# Altium project ESC-FPV.PrjPcb
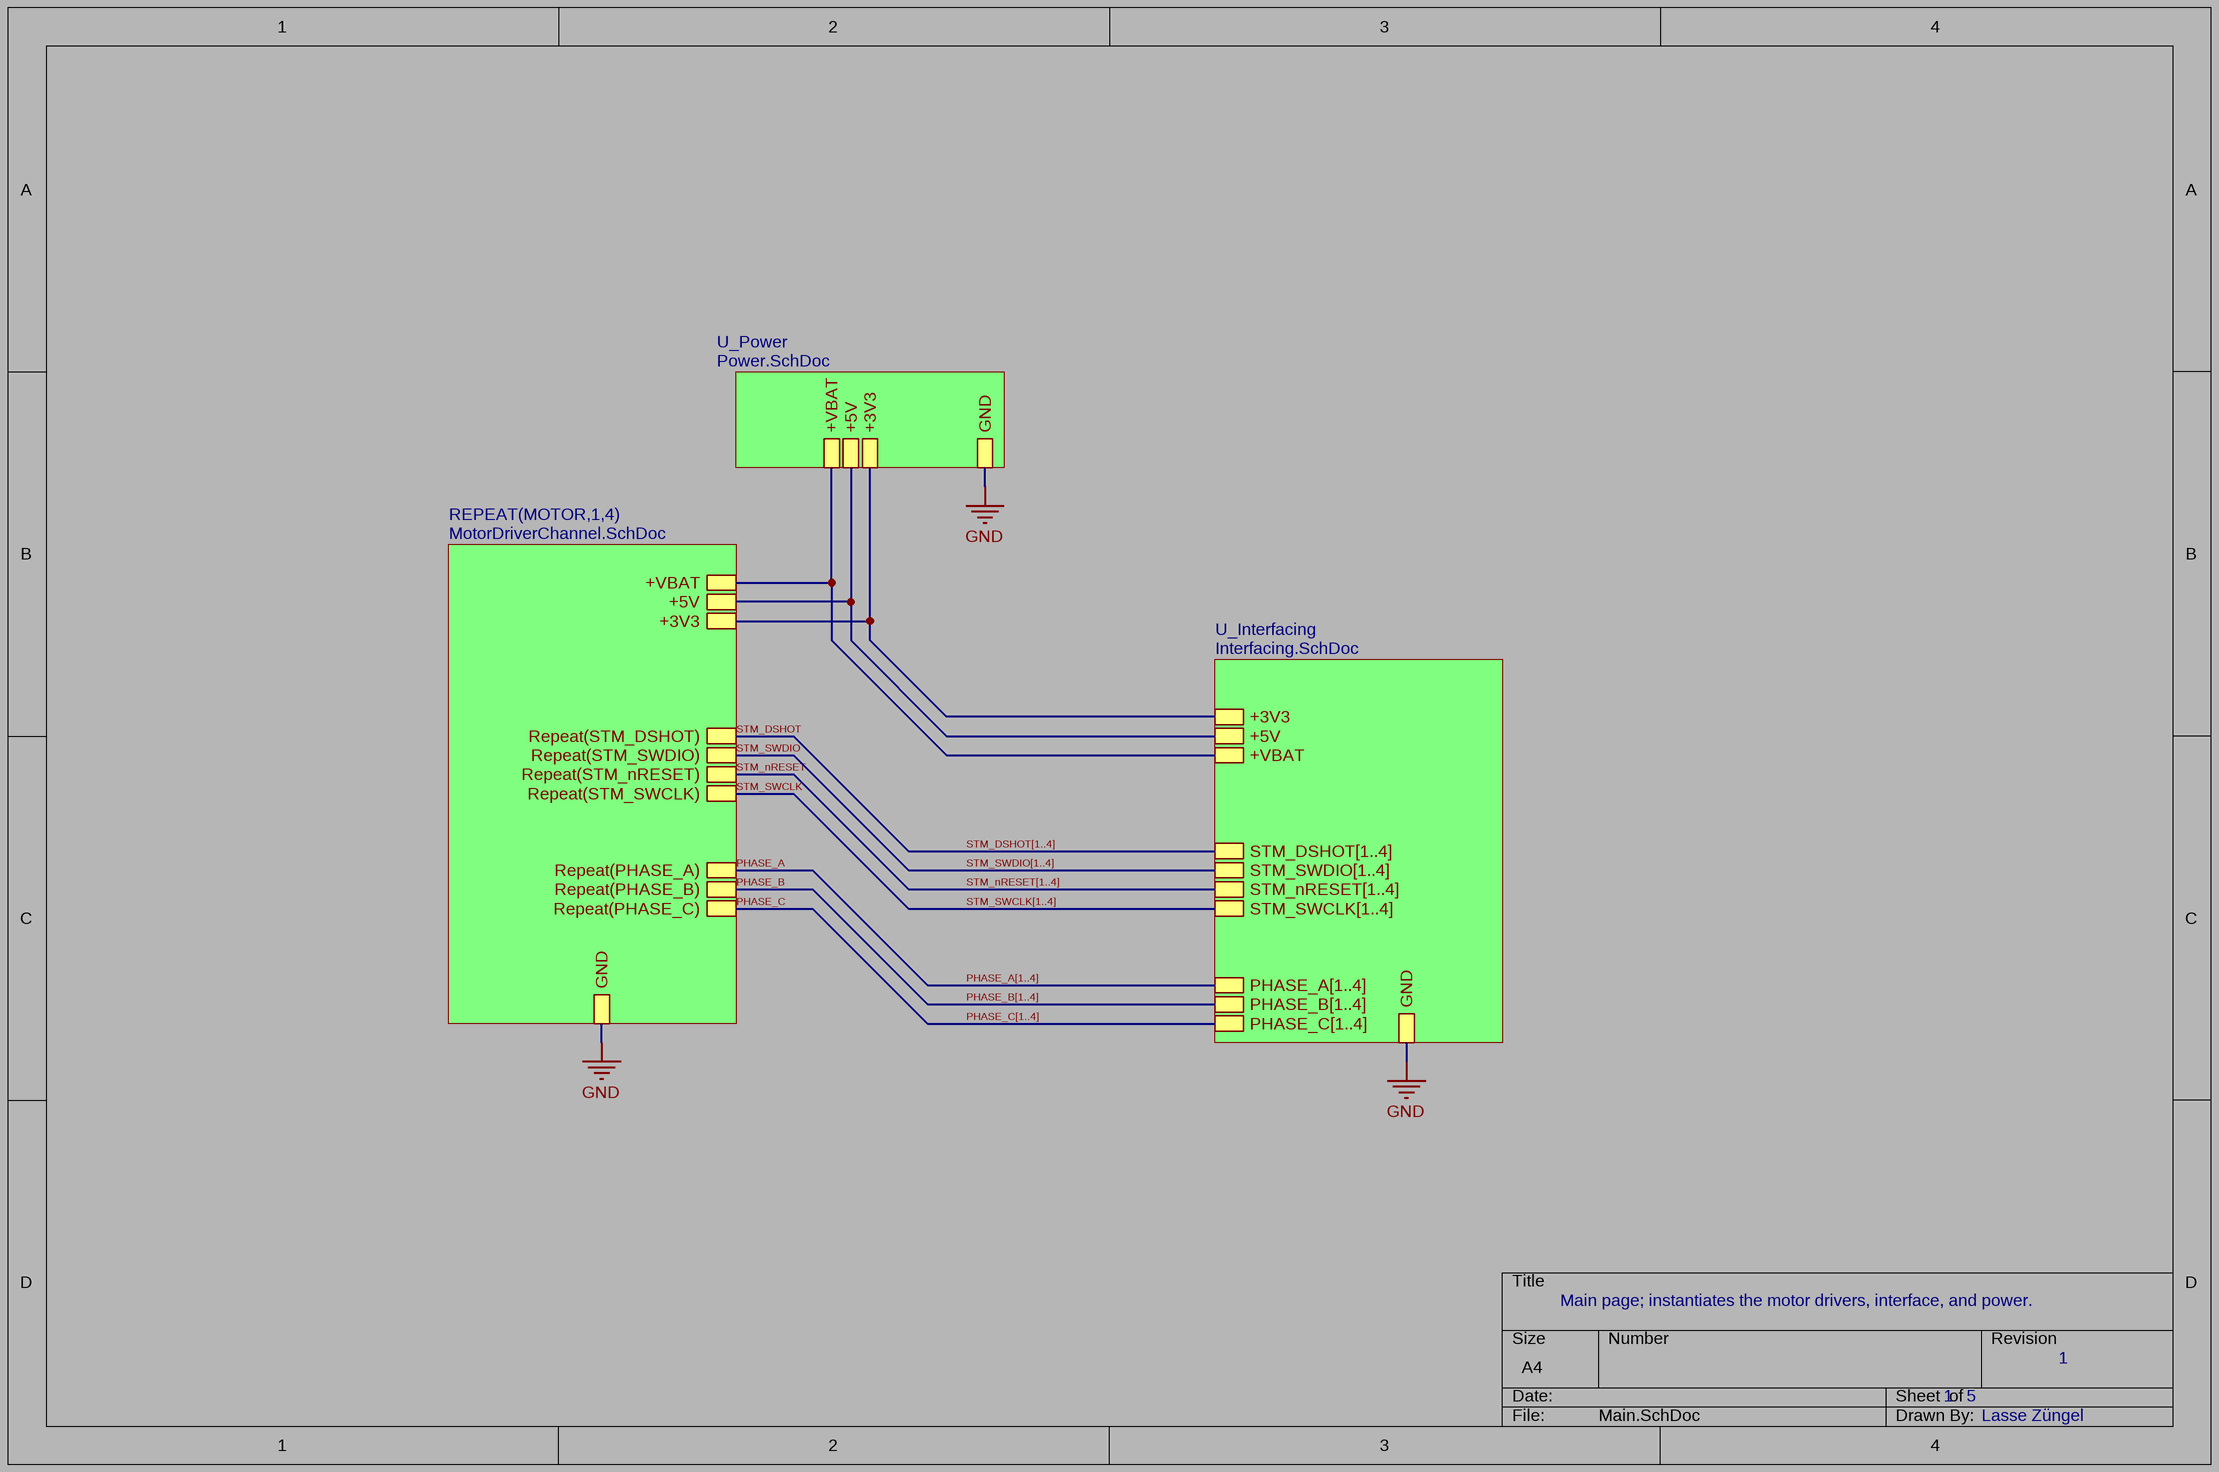
[diagram p0: Main.SchDoc]
5 sheets, 226 parts. Net scope: strictly hierarchical (ports join the sheet entries above them; power ports are local).
Board file: PCB.PcbDoc
Sheets:
  Main.SchDoc
    MOTOR1 = MotorDriverChannel.SchDoc
    MOTOR2 = MotorDriverChannel.SchDoc
    MOTOR3 = MotorDriverChannel.SchDoc
    MOTOR4 = MotorDriverChannel.SchDoc
    U_Power = Power.SchDoc
    U_Interfacing = Interfacing.SchDoc
      MotorConnection1 = MotorConnection.SchDoc
      MotorConnection2 = MotorConnection.SchDoc
      MotorConnection3 = MotorConnection.SchDoc
      MotorConnection4 = MotorConnection.SchDoc

## Sheet Main.SchDoc
size A4; SheetNumber: 1; SheetTotal: 5

### Sub-sheets
REPEAT(MOTOR,1,4) = MotorDriverChannel.SchDoc: +VBAT, +5V, +3V3, GND, Repeat(PHASE_A), Repeat(PHASE_B), Repeat(PHASE_C), Repeat(STM_SWDIO), Repeat(STM_nRESET), Repeat(STM_SWCLK), Repeat(STM_DSHOT)
U_Interfacing = Interfacing.SchDoc: +VBAT, STM_DSHOT[1..4], STM_SWDIO[1..4], STM_SWCLK[1..4], STM_nRESET[1..4], +3V3, +5V, GND, PHASE_A[1..4], PHASE_B[1..4], PHASE_C[1..4]
U_Power = Power.SchDoc: +VBAT, +5V, +3V3, GND

### Nets
+3V3: sheet REPEAT(MOTOR,1,4)/+3V3, sheet U_Power/+3V3, sheet U_Interfacing/+3V3
+5V: sheet REPEAT(MOTOR,1,4)/+5V, sheet U_Power/+5V, sheet U_Interfacing/+5V
+VBAT: sheet REPEAT(MOTOR,1,4)/+VBAT, sheet U_Power/+VBAT, sheet U_Interfacing/+VBAT
GND: sheet REPEAT(MOTOR,1,4)/GND, sheet U_Power/GND, sheet U_Interfacing/GND
PHASE_A: sheet REPEAT(MOTOR,1,4)/Repeat(PHASE_A)
PHASE_B: sheet REPEAT(MOTOR,1,4)/Repeat(PHASE_B)
PHASE_C: sheet REPEAT(MOTOR,1,4)/Repeat(PHASE_C)
STM_DSHOT: sheet REPEAT(MOTOR,1,4)/Repeat(STM_DSHOT)
STM_nRESET: sheet REPEAT(MOTOR,1,4)/Repeat(STM_nRESET)
STM_SWCLK: sheet REPEAT(MOTOR,1,4)/Repeat(STM_SWCLK)
STM_SWDIO: sheet REPEAT(MOTOR,1,4)/Repeat(STM_SWDIO)

### Buses and harness runs
bus PHASE_A[1..4] = sheet U_Interfacing/PHASE_A[1..4]
bus PHASE_B[1..4] = sheet U_Interfacing/PHASE_B[1..4]
bus PHASE_C[1..4] = sheet U_Interfacing/PHASE_C[1..4]
bus STM_DSHOT[1..4] = sheet U_Interfacing/STM_DSHOT[1..4]
bus STM_nRESET[1..4] = sheet U_Interfacing/STM_nRESET[1..4]
bus STM_SWCLK[1..4] = sheet U_Interfacing/STM_SWCLK[1..4]
bus STM_SWDIO[1..4] = sheet U_Interfacing/STM_SWDIO[1..4]

### Notes on the sheet
- Main page; instantiates the motor drivers, interface, and power.
- 1   5
- 1
- Lasse Züngel

## Sheet MotorDriverChannel.SchDoc
size A4; SheetNumber: 2; SheetTotal: 5
Used 4 times, as channels MOTOR1, MOTOR2, MOTOR3, MOTOR4. Parts and nets are listed once, with the designators drawn on the sheet.
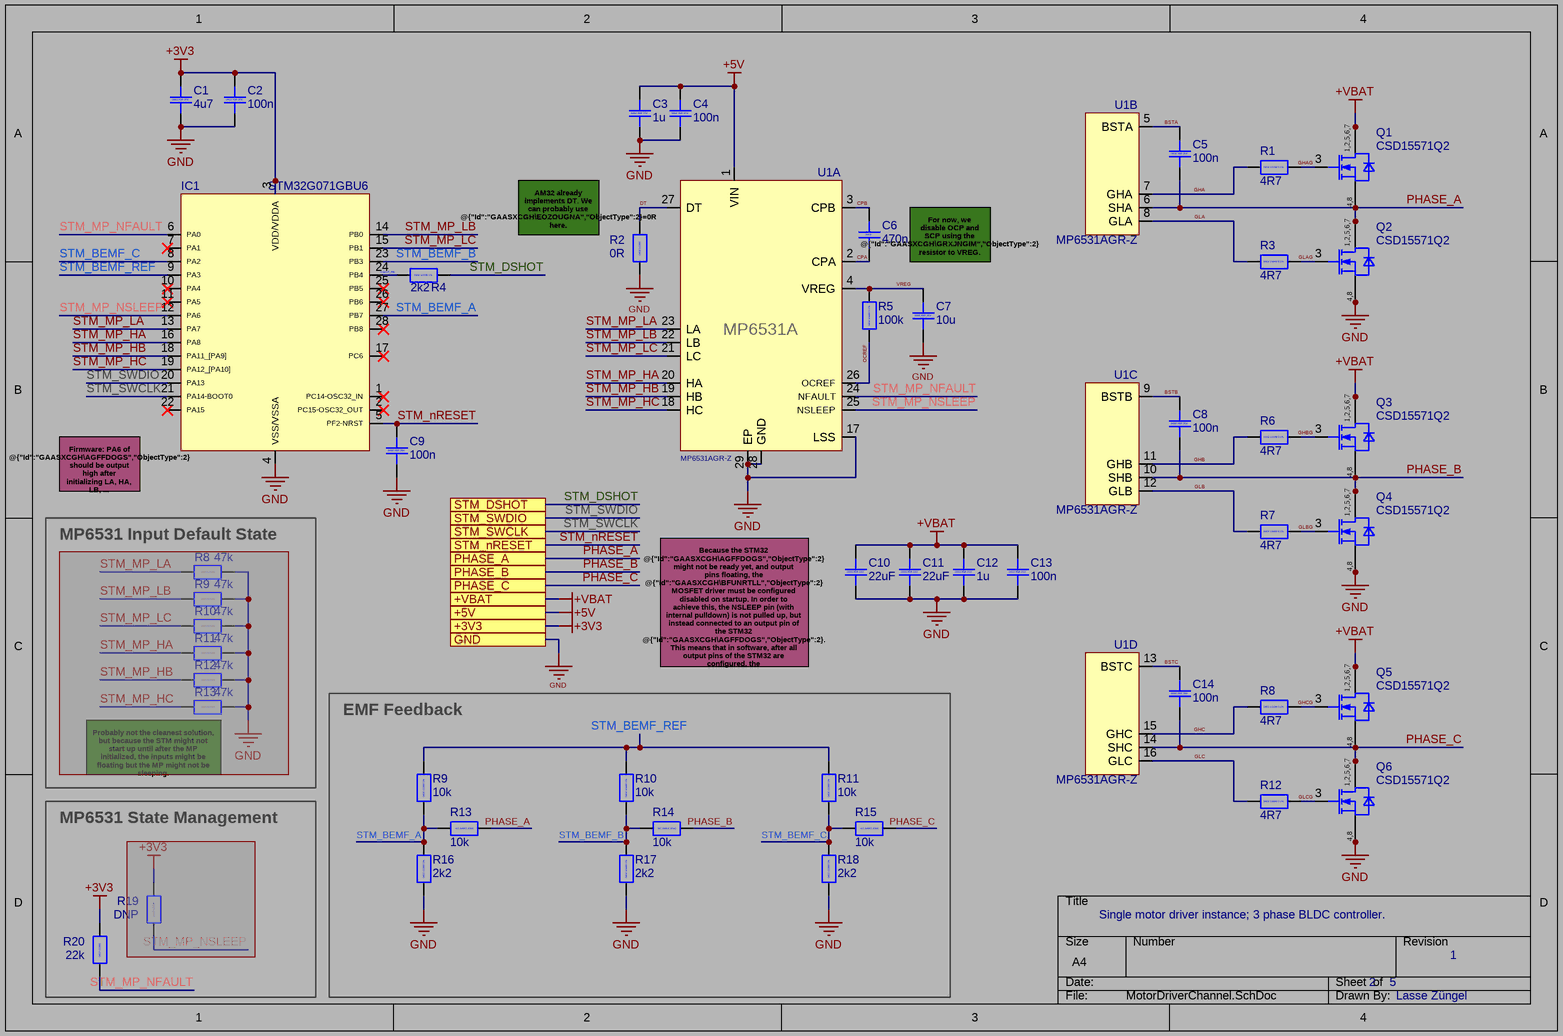
[diagram p1: MotorDriverChannel.SchDoc]

### Parts
(Parts that share a designator on the sheet are numbered #1, #2 ... from top to bottom, then left to right.)
C1  4u7  [CAP_0603_L]
C2  100n  [CAP_0402]
C3  1u  [CAP_0402]
C4  100n  [CAP_0402]
C5  100n  [CAP_0402]
C6  470n  [CAP_0402]
C7  10u  [CAP_0805s]
C8  100n  [CAP_0402]
C9  100n  [CAP_0402]
C10  22uF  [CAP_0805s]
C11  22uF  [CAP_0805s]
C12  1u  [CAP_0603_L]
C13  100n  [CAP_0402]
C14  100n  [CAP_0402]
IC1  STM32G071GBU6  [UFQFN28-STM32]
Q1  CSD15571Q2  [CSD15571Q2]
Q2  CSD15571Q2  [CSD15571Q2]
Q3  CSD15571Q2  [CSD15571Q2]
Q4  CSD15571Q2  [CSD15571Q2]
Q5  CSD15571Q2  [CSD15571Q2]
Q6  CSD15571Q2  [CSD15571Q2]
R1  4R7  [RES_0402]
R2  0R  [RES_0402]
R3  4R7  [RES_0402]
R4  2k2  [RES_0402]
R5  100k  [RES_0402]
R6  4R7  [RES_0402]
R7  4R7  [RES_0402]
R8#1  47k  [RES_0402]  (masked out: inside a compile mask, not in the netlist)
R8#2  4R7  [RES_0402]
R9#1  47k  [RES_0402]  (masked out: inside a compile mask, not in the netlist)
R9#2  10k  [RES_0402]
R10#1  47k  [RES_0402]  (masked out: inside a compile mask, not in the netlist)
R10#2  10k  [RES_0402]
R11#1  47k  [RES_0402]  (masked out: inside a compile mask, not in the netlist)
R11#2  10k  [RES_0402]
R12#1  47k  [RES_0402]  (masked out: inside a compile mask, not in the netlist)
R12#2  4R7  [RES_0402]
R13#1  47k  [RES_0402]  (masked out: inside a compile mask, not in the netlist)
R13#2  10k  [RES_0402]
R14  10k  [RES_0402]
R15  10k  [RES_0402]
R16  2k2  [RES_0402]
R17  2k2  [RES_0402]
R18  2k2  [RES_0402]
R19  DNP  [RES_0402]  (masked out: inside a compile mask, not in the netlist)
R20  22k  [RES_0402]
U1  MP6531AGR-Z  [MP6531A-QFN40P400X400X100-29N]  (parts A,B,C,D of 4)

### Blocks framed on the sheet
MP6531 Input Default State: R8#1 R9#1 R10#1 R11#1 R12#1 R13#1
EMF Feedback: R9#2 R10#2 R11#2 R13#2 R14-R18
MP6531 State Management: R19 R20

### Ports
+3V3 (see Main[2B], Interfacing[1A], Power[1B]), +5V (see Main[2B], Interfacing[1A], Power[1B]), +VBAT (see Main[2B], Interfacing[2B], Power[1B]), GND (see Main[2C], Interfacing[1A], Power[1B]), PHASE_A (see Main[2C], MotorConnection[1A]), PHASE_B (see Main[2C], MotorConnection[1A]), PHASE_C (see Main[2C], MotorConnection[1A]), STM_DSHOT (see Main[2C]), STM_nRESET (see Main[2C]), STM_SWCLK (see Main[2C]), STM_SWDIO (see Main[2C])

### Nets
+3V3: C1.2 C2.2 IC1.3(VDD/VDDA) R20.2 ; port +3V3
+5V: C3.2 C4.2 U1.1(VIN) ; port +5V
+VBAT: C10.2 C11.2 C12.2 C13.2 Q1.1(D_1) Q1.2(D_2) Q1.5(D_3) Q1.6(D_4) Q1.7(D_5) Q3.1(D_1) Q3.2(D_2) Q3.5(D_3) Q3.6(D_4) Q3.7(D_5) Q5.1(D_1) Q5.2(D_2) Q5.5(D_3) Q5.6(D_4) Q5.7(D_5) ; port +VBAT
GND: C1.1 C2.1 C3.1 C4.1 C7.1 C9.1 C10.1 C11.1 C12.1 C13.1 IC1.4(VSS/VSSA) Q2.4(S_1) Q2.8(S_2) Q4.4(S_1) Q4.8(S_2) Q6.4(S_1) Q6.8(S_2) R2.1 R16.1 R17.1 R18.1 U1.17(LSS) U1.28(GND) U1.29(EP) ; port GND
BSTA: C5.2 U1.5(BSTA)
BSTB: C8.2 U1.9(BSTB)
BSTC: C14.2 U1.13(BSTC)
CPA: C6.1 U1.2(CPA)
CPB: C6.2 U1.3(CPB)
DSHOT_PIN: IC1.24(PB4) R4.1
DT: R2.2 U1.27(DT)
GHA: R1.1 U1.7(GHA)
GHAG: Q1.3(G) R1.2
GHB: R6.1 U1.11(GHB)
GHBG: Q3.3(G) R6.2
GHC: R8#2.1 U1.15(GHC)
GHCG: Q5.3(G) R8#2.2
GLA: R3.1 U1.8(GLA)
GLAG: Q2.3(G) R3.2
GLB: R7.1 U1.12(GLB)
GLBG: Q4.3(G) R7.2
GLC: R12#2.1 U1.16(GLC)
GLCG: Q6.3(G) R12#2.2
OCREF: R5.1 U1.26(OCREF)
PHASE_A: C5.1 Q1.4(S_1) Q1.8(S_2) Q2.1(D_1) Q2.2(D_2) Q2.5(D_3) Q2.6(D_4) Q2.7(D_5) R13#2.1 U1.6(SHA) ; port PHASE_A
PHASE_B: C8.1 Q3.4(S_1) Q3.8(S_2) Q4.1(D_1) Q4.2(D_2) Q4.5(D_3) Q4.6(D_4) Q4.7(D_5) R14.1 U1.10(SHB) ; port PHASE_B
PHASE_C: C14.1 Q5.4(S_1) Q5.8(S_2) Q6.1(D_1) Q6.2(D_2) Q6.5(D_3) Q6.6(D_4) Q6.7(D_5) R15.1 U1.14(SHC) ; port PHASE_C
STM_BEMF_A: IC1.27(PB7) R9#2.1 R13#2.2 R16.2
STM_BEMF_B: IC1.23(PB3) R10#2.1 R14.2 R17.2
STM_BEMF_C: IC1.8(PA2) R11#2.1 R15.2 R18.2
STM_BEMF_REF: IC1.9(PA3) R9#2.2 R10#2.2 R11#2.2
STM_DSHOT: R4.2 ; port STM_DSHOT
STM_MP_HA: IC1.16(PA8) U1.20(HA)
STM_MP_HB: IC1.18(PA11_[PA9]) U1.19(HB)
STM_MP_HC: IC1.19(PA12_[PA10]) U1.18(HC)
STM_MP_LA: IC1.13(PA7) U1.23(LA)
STM_MP_LB: IC1.14(PB0) U1.22(LB)
STM_MP_LC: IC1.15(PB1) U1.21(LC)
STM_MP_NFAULT: IC1.6(PA0) R20.1 U1.24(NFAULT)
STM_MP_NSLEEP: IC1.12(PA6) U1.25(NSLEEP)
STM_nRESET: C9.2 IC1.5(PF2-NRST) ; port STM_nRESET
STM_SWCLK: IC1.21(PA14-BOOT0) ; port STM_SWCLK
STM_SWDIO: IC1.20(PA13) ; port STM_SWDIO
VREG: C7.2 R5.2 U1.4(VREG)

Not connected (* = marked no-connect by the designer): IC1 1(PC14-OSC32_IN)* 2(PC15-OSC32_OUT)* 7(PA1)* 10(PA4)* 11(PA5)* 17(PC6)* 22(PA15)* 25(PB5)* 26(PB6)* 28(PB8)*

### Channels
MOTOR1: designators C1=C1_MOTOR1 C2=C2_MOTOR1 C3=C3_MOTOR1 C4=C4_MOTOR1 C5=C5_MOTOR1 C6=C6_MOTOR1 C7=C7_MOTOR1 C8=C8_MOTOR1 C9=C9_MOTOR1 C10=C10_MOTOR1 C11=C11_MOTOR1 C12=C12_MOTOR1 C13=C13_MOTOR1 C14=C14_MOTOR1 IC1=IC1_MOTOR1 Q1=Q1_MOTOR1 Q2=Q2_MOTOR1 Q3=Q3_MOTOR1 Q4=Q4_MOTOR1 Q5=Q5_MOTOR1 Q6=Q6_MOTOR1 R1=R1_MOTOR1 R2=R2_MOTOR1 R3=R3_MOTOR1 R4=R4_MOTOR1 R5=R5_MOTOR1 R6=R6_MOTOR1 R7=R7_MOTOR1 R8=R8_MOTOR1#1 R8=R8_MOTOR1#2 R9=R9_MOTOR1#1 R9=R9_MOTOR1#2 R10=R10_MOTOR1#1 R10=R10_MOTOR1#2 R11=R11_MOTOR1#1 R11=R11_MOTOR1#2 R12=R12_MOTOR1#1 R12=R12_MOTOR1#2 R13=R13_MOTOR1#1 R13=R13_MOTOR1#2 R14=R14_MOTOR1 R15=R15_MOTOR1 R16=R16_MOTOR1 R17=R17_MOTOR1 R18=R18_MOTOR1 R19=R19_MOTOR1 R20=R20_MOTOR1 U1=U1_MOTOR1; ports +3V3=+3V3 +5V=+5V +VBAT=+VBAT GND=GND PHASE_A=PHASE_A1 PHASE_B=PHASE_B1 PHASE_C=PHASE_C1 STM_DSHOT=STM_DSHOT1 STM_nRESET=STM_nRESET1 STM_SWCLK=STM_SWCLK1 STM_SWDIO=STM_SWDIO1
MOTOR2: designators C1=C1_MOTOR2 C2=C2_MOTOR2 C3=C3_MOTOR2 C4=C4_MOTOR2 C5=C5_MOTOR2 C6=C6_MOTOR2 C7=C7_MOTOR2 C8=C8_MOTOR2 C9=C9_MOTOR2 C10=C10_MOTOR2 C11=C11_MOTOR2 C12=C12_MOTOR2 C13=C13_MOTOR2 C14=C14_MOTOR2 IC1=IC1_MOTOR2 Q1=Q1_MOTOR2 Q2=Q2_MOTOR2 Q3=Q3_MOTOR2 Q4=Q4_MOTOR2 Q5=Q5_MOTOR2 Q6=Q6_MOTOR2 R1=R1_MOTOR2 R2=R2_MOTOR2 R3=R3_MOTOR2 R4=R4_MOTOR2 R5=R5_MOTOR2 R6=R6_MOTOR2 R7=R7_MOTOR2 R8=R8_MOTOR2#1 R8=R8_MOTOR2#2 R9=R9_MOTOR2#1 R9=R9_MOTOR2#2 R10=R10_MOTOR2#1 R10=R10_MOTOR2#2 R11=R11_MOTOR2#1 R11=R11_MOTOR2#2 R12=R12_MOTOR2#1 R12=R12_MOTOR2#2 R13=R13_MOTOR2#1 R13=R13_MOTOR2#2 R14=R14_MOTOR2 R15=R15_MOTOR2 R16=R16_MOTOR2 R17=R17_MOTOR2 R18=R18_MOTOR2 R19=R19_MOTOR2 R20=R20_MOTOR2 U1=U1_MOTOR2; ports +3V3=+3V3 +5V=+5V +VBAT=+VBAT GND=GND PHASE_A=PHASE_A2 PHASE_B=PHASE_B2 PHASE_C=PHASE_C2 STM_DSHOT=STM_DSHOT2 STM_nRESET=STM_nRESET2 STM_SWCLK=STM_SWCLK2 STM_SWDIO=STM_SWDIO2
MOTOR3: designators C1=C1_MOTOR3 C2=C2_MOTOR3 C3=C3_MOTOR3 C4=C4_MOTOR3 C5=C5_MOTOR3 C6=C6_MOTOR3 C7=C7_MOTOR3 C8=C8_MOTOR3 C9=C9_MOTOR3 C10=C10_MOTOR3 C11=C11_MOTOR3 C12=C12_MOTOR3 C13=C13_MOTOR3 C14=C14_MOTOR3 IC1=IC1_MOTOR3 Q1=Q1_MOTOR3 Q2=Q2_MOTOR3 Q3=Q3_MOTOR3 Q4=Q4_MOTOR3 Q5=Q5_MOTOR3 Q6=Q6_MOTOR3 R1=R1_MOTOR3 R2=R2_MOTOR3 R3=R3_MOTOR3 R4=R4_MOTOR3 R5=R5_MOTOR3 R6=R6_MOTOR3 R7=R7_MOTOR3 R8=R8_MOTOR3#1 R8=R8_MOTOR3#2 R9=R9_MOTOR3#1 R9=R9_MOTOR3#2 R10=R10_MOTOR3#1 R10=R10_MOTOR3#2 R11=R11_MOTOR3#1 R11=R11_MOTOR3#2 R12=R12_MOTOR3#1 R12=R12_MOTOR3#2 R13=R13_MOTOR3#1 R13=R13_MOTOR3#2 R14=R14_MOTOR3 R15=R15_MOTOR3 R16=R16_MOTOR3 R17=R17_MOTOR3 R18=R18_MOTOR3 R19=R19_MOTOR3 R20=R20_MOTOR3 U1=U1_MOTOR3; ports +3V3=+3V3 +5V=+5V +VBAT=+VBAT GND=GND PHASE_A=PHASE_A3 PHASE_B=PHASE_B3 PHASE_C=PHASE_C3 STM_DSHOT=STM_DSHOT3 STM_nRESET=STM_nRESET3 STM_SWCLK=STM_SWCLK3 STM_SWDIO=STM_SWDIO3
MOTOR4: designators C1=C1_MOTOR4 C2=C2_MOTOR4 C3=C3_MOTOR4 C4=C4_MOTOR4 C5=C5_MOTOR4 C6=C6_MOTOR4 C7=C7_MOTOR4 C8=C8_MOTOR4 C9=C9_MOTOR4 C10=C10_MOTOR4 C11=C11_MOTOR4 C12=C12_MOTOR4 C13=C13_MOTOR4 C14=C14_MOTOR4 IC1=IC1_MOTOR4 Q1=Q1_MOTOR4 Q2=Q2_MOTOR4 Q3=Q3_MOTOR4 Q4=Q4_MOTOR4 Q5=Q5_MOTOR4 Q6=Q6_MOTOR4 R1=R1_MOTOR4 R2=R2_MOTOR4 R3=R3_MOTOR4 R4=R4_MOTOR4 R5=R5_MOTOR4 R6=R6_MOTOR4 R7=R7_MOTOR4 R8=R8_MOTOR4#1 R8=R8_MOTOR4#2 R9=R9_MOTOR4#1 R9=R9_MOTOR4#2 R10=R10_MOTOR4#1 R10=R10_MOTOR4#2 R11=R11_MOTOR4#1 R11=R11_MOTOR4#2 R12=R12_MOTOR4#1 R12=R12_MOTOR4#2 R13=R13_MOTOR4#1 R13=R13_MOTOR4#2 R14=R14_MOTOR4 R15=R15_MOTOR4 R16=R16_MOTOR4 R17=R17_MOTOR4 R18=R18_MOTOR4 R19=R19_MOTOR4 R20=R20_MOTOR4 U1=U1_MOTOR4; ports +3V3=+3V3 +5V=+5V +VBAT=+VBAT GND=GND PHASE_A=PHASE_A4 PHASE_B=PHASE_B4 PHASE_C=PHASE_C4 STM_DSHOT=STM_DSHOT4 STM_nRESET=STM_nRESET4 STM_SWCLK=STM_SWCLK4 STM_SWDIO=STM_SWDIO4

### Notes on the sheet
- (near R2) AM32 already implements DT. We can probably use @{"Id":"GAASXCGH\EOZOUGNA","ObjectType":2}=0R here.
- For now, we disable OCP and SCP using the @{"Id":"GAASXCGH\GRXJNGIM","ObjectType":2} resistor to VREG.
- (near IC1) Firmware: PA6 of @{"Id":"GAASXCGH\AGFFDOGS","ObjectType":2} should be output high after initializing LA, HA, LB, ...
- (near C10) Because the STM32 @{"Id":"GAASXCGH\AGFFDOGS","ObjectType":2} might not be ready yet, and output pins floating, the @{"Id":"GAASXCGH\BFUNRTLL","ObjectType":2} MOSFET driver must be configured disabled on startup. In order to achieve this, the NSLEEP pin (with internal pulldown) is not pulled up, but instead connected to an output pin of the STM32 @{"Id":"GAASXCGH\AGFFDOGS","ObjectType":2}. This means that in software, after all output pins of the STM32 are configured, the @{"Id":"GAASXCGH\RPXEHWLX","ObjectType":1} pin should be driven high to enable the MOSFET driver.
- (near R13#1) Probably not the cleanest solution, but because the STM might not start up until after the MP initialized, the inputs might be floating but the MP might not be sleeping.
  This way, we don't have to touch the AM32 firmware.
- Single motor driver instance; 3 phase BLDC controller.
- 2    5
- 1
- Lasse Züngel
- (in symbol AC0402FR-7D2K2L) 0402 1/16W 1%
- (in symbol AE0402BR-07100KL) 0402 1/16W 0.1%
- (in symbol CAP_0402) 0402
- (in symbol CAP_0402_X5R_25V) 0402 X5R 25V
- (in symbol CAP_0603_X5R_25V) 0603 X5R 25V
- (in symbol CSD15571Q2) 1,2,5,6,7; 4,8
- (in symbol GXT21BR61C226ME13L) 0805 X5R 16V
- (in symbol MCAST21GBB5106KTNA01) 0805 X5R 25V
- (in symbol MP6531AGR-Z, part A) MP6531A
- (in symbol RC0402FR-7W4R7L) 0402 1/16W 0.1%
- (in symbol RES_0402) 0402 1/16W
- (in symbol RES_0402_1PERCENT) 0402 1/16W 1%

### Library data of the parts
C1 C12 = CAP_0603_X5R_25V: Capacitor 0603 generic, X5R, 25V
C2-C5 C8 C9 C13 C14 = CAP_0402_X5R_25V: Capacitor 0402 generic, X5R, 25V
C6 = CAP_0402: Capacitor 0402 generic
C7 = MCAST21GBB5106KTNA01: Multilayer Ceramic Capacitors MLCC - SMD/SMT 25V 10uF X5R 0805 10%; Manufacturer_Name: TAIYO YUDEN; Datasheet Link: https://www.mouser.com/catalog/specsheets/Taiyo%20Yuden_1102023_MC_mlcc_all_e.pdf; Manufacturer_Part_Number: MCAST21GBB5106KTNA01
C10 C11 = GXT21BR61C226ME13L: Multilayer Ceramic Capacitors MLCC - SMD/SMT 0805 16VDC 22uF 20% X5R AEC-Q200; Manufacturer_Name: Murata Electronics; Datasheet Link: https://www.mouser.de/datasheet/3/76/4/GXT21BR61C226ME13_01A.pdf; Manufacturer_Part_Number: GXT21BR61C226ME13L
IC1 = STM32G071GBU6: Integrated Circuit; Manufacturer_Name: STMicroelectronics; Datasheet Link: https://www.st.com/resource/en/datasheet/stm32g071c8.pdf; Height: 0.6mm; Manufacturer_Part_Number: STM32G071GBU6; Mouser Part Number: 511-STM32G071GBU6; Mouser Price/Stock: https://www.mouser.co.uk/ProductDetail/STMicroelectronics/STM32G071GBU6?qs=PqoDHHvF64%2FgmAx6dD98Vg%3D%3D; Arrow Part Number: STM32G071GBU6; Arrow Price/Stock: https://www.arrow.com/en/products/stm32g071gbu6/stmicroelectronics?region=nac
Q1-Q6 = CSD15571Q2: MOSFET 20V N-Channel NexFET Pwr MOSFET; Manufacturer_Name: Texas Instruments; Datasheet Link: http://www.ti.com/lit/gpn/csd15571q2; Height: 0.8mm; Manufacturer_Part_Number: CSD15571Q2; Mouser Part Number: 595-CSD15571Q2; Mouser Price/Stock: https://www.mouser.co.uk/ProductDetail/Texas-Instruments/CSD15571Q2?qs=OGNXFUZBARuNT0xCwaBM7Q%3D%3D; Arrow Part Number: CSD15571Q2; Arrow Price/Stock: https://www.arrow.com/en/products/csd15571q2/texas-instruments
R1 R3 R6 R7 R8#2 R12#2 = RC0402FR-7W4R7L: Thick Film Resistors - SMD General Purpose Chip Resistor 0402, 4.7Ohms, 1%, 1/16W; Manufacturer_Name: YAGEO; Manufacturer_Part_Number: RC0402FR-7W4R7L
R2 R8#1 R9#1 R10#1 R11#1 R12#1 R13#1 R19 R20 = RES_0402: Resistor 0402 generic, 1/16W
R4 R16-R18 = AC0402FR-7D2K2L: Thick Film Resistors - SMD 2.2 kOhms 1/16 W 50 V 1 % 0402 100 PPM / C - 55 C / + 155 C AEC-Q200; Manufacturer_Name: YAGEO; Manufacturer_Part_Number: AC0402FR-7D2K2L
R5 = AE0402BR-07100KL: Thick Film Resistors - SMD 100KOhm 0402 1/3W 0.1% Hal Free AEC-Q200; Manufacturer_Name: YAGEO; Datasheet Link: https://yageogroup.com/content/datasheet/asset/file/PYU-AE_51_ROHS_L; Manufacturer_Part_Number: AE0402BR-07100KL
R9#2 R10#2 R11#2 R13#2 R14 R15 = RES_0402_1PERCENT: Resistor 0402 generic, 1/16W, 1%
U1 = MP6531AGR-Z: Integrated Circuit; Manufacturer_Name: Monolithic Power Systems (MPS); Datasheet Link: https://www.monolithicpower.com/en/documentview/productdocument/index/version/2/document_type/Datasheet/lang/en/sku/MP6531A/document_id/1862/; Height: 1mm; Manufacturer_Part_Number: MP6531AGR-Z; Mouser Part Number: 946-MP6531AGR-Z; Mouser Price/Stock: https://www.mouser.co.uk/ProductDetail/Monolithic-Power-Systems-MPS/MP6531AGR-Z?qs=5aG0NVq1C4xl7PDY2hKmEA%3D%3D

## Sheet Power.SchDoc
size A4; SheetNumber: 3; SheetTotal: 5
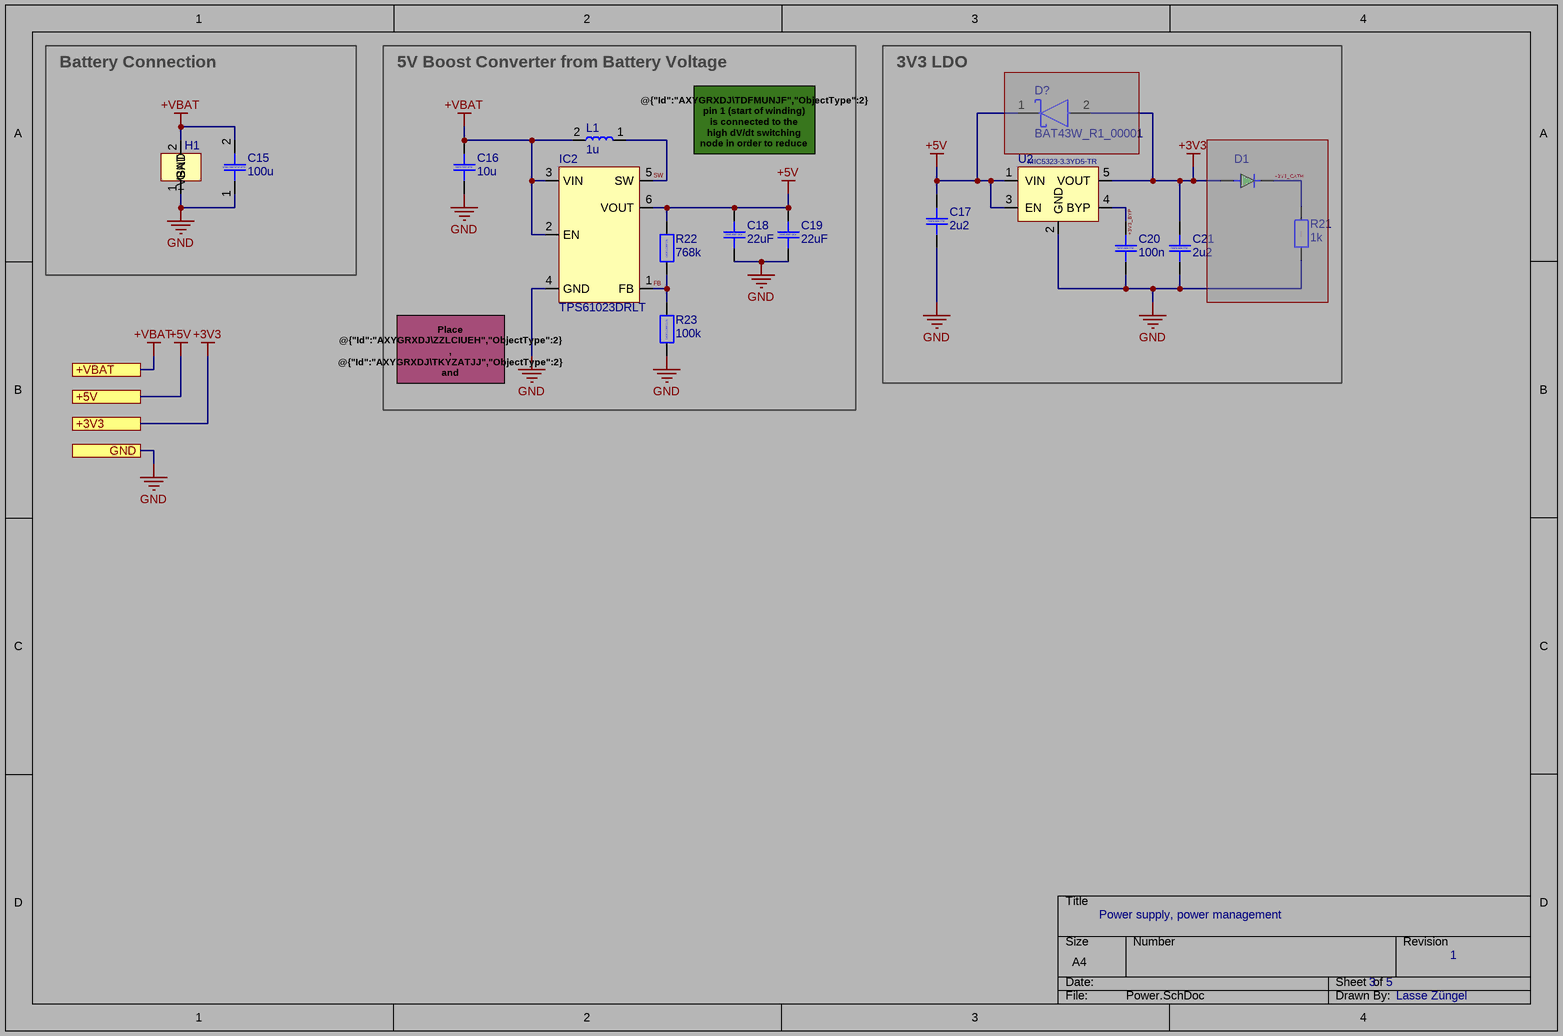
[diagram p2: Power.SchDoc]

### Parts
C15  100u  [CAP_1210]
C16  10u  [CAP_0805s]
C17  2u2  [CAP_0603_L]
C18  22uF  [CAP_0805s]
C19  22uF  [CAP_0805s]
C20  100n  [CAP_0402]
C21  2u2  [CAP_0603_L]
D1  SMD_LED_0603  [SMD_LED_0603]  (value not drawn)  (masked out: inside a compile mask, not in the netlist)
D?  BAT43W_R1_00001  [SOD123]  (masked out: inside a compile mask, not in the netlist)
H1  BatteryWireSoldering  [BatteryWireSoldering]  (value not drawn)
IC2  TPS61023DRLT  [SOTFL50P160X60-6N]
L1  1u  [74438357010]
R21  1k  [RES_0603]  (masked out: inside a compile mask, not in the netlist)
R22  768k  [RES_0402]
R23  100k  [RES_0402]
U2  MIC5323-3.3YD5-TR  [SPX3819M5-L-3-3/TR]

### Blocks framed on the sheet
Battery Connection: C15 H1
5V Boost Converter from Battery Voltage: C16 C18 C19 IC2 L1 R22 R23
3V3 LDO: C17 C20 C21 D1 D? R21 U2

### Ports
+3V3 (see Main[2B], Interfacing[1A], MotorDriverChannel[2C]), +5V (see Main[2B], Interfacing[1A], MotorDriverChannel[2C]), +VBAT (see Main[2B], Interfacing[2B], MotorDriverChannel[2C]), GND (see Main[2B], Interfacing[1A], MotorDriverChannel[2C])

### Nets
+3V3: C21.2 U2.5(VOUT) ; port +3V3
+5V: C17.2 C18.2 C19.2 IC2.6(VOUT) R22.2 U2.1(VIN) U2.3(EN) ; port +5V
+VBAT: C15.2(-) C16.2 H1.2(+VBAT) IC2.2(EN) IC2.3(VIN) L1.2 ; port +VBAT
GND: C15.1(+) C16.1 C17.1 C18.1 C19.1 C20.1 C21.1 H1.1(GND) IC2.4(GND) R23.1 U2.2(GND) ; port GND
+3V3_BYP: C20.2 U2.4(BYP)
FB: IC2.1(FB) R22.1 R23.2
SW: IC2.5(SW) L1.1

### Notes on the sheet
- @{"Id":"AXYGRXDJ\TDFMUNJF","ObjectType":2} pin 1 (start of winding) is connected to the high dV/dt switching node in order to reduce EMI.
- Place @{"Id":"AXYGRXDJ\ZZLCIUEH","ObjectType":2} , @{"Id":"AXYGRXDJ\TKYZATJJ","ObjectType":2} and @{"Id":"AXYGRXDJ\BTTPASSS","ObjectType":2} very close to the respective pins. Keep the loop areas small!
- Power supply, power management
- 3   5
- 1
- Lasse Züngel
- (in symbol AC0402FR-07768KL) 0402 1/16W 1%
- (in symbol AE0402BR-07100KL) 0402 1/16W 0.1%
- (in symbol CAP_0402_X5R_25V) 0402 X5R 25V
- (in symbol CAP_0603_X5R_25V) 0603 X5R 25V
- (in symbol GXT21BR61C226ME13L) 0805 X5R 16V
- (in symbol MCAST21GBB5106KTNA01) 0805 X5R 25V
- (in symbol MSASE32MAB5107MPNA01) 100u 16V 1210 20%
- (in symbol RES_0603) 0603

### Library data of the parts
C15 = MSASE32MAB5107MPNA01: Multilayer Ceramic Capacitors MLCC - SMD/SMT 16V 100uF X5R 1210 20 %; Manufacturer_Name: TAIYO YUDEN; Datasheet Link: https://www.mouser.com/catalog/specsheets/Tayio_Yuden_1102023_MS_mlcc_all_e.pdf?_gl=1*1rxg4sj*_gcl_aw*R0NMLjE3ODg0ODY5MTcuQ2p3S0NBand3SnpQQmhCUkVpd0FKZkhSblM5ekZUOGFxTzJkNFhkWjRHZDBxQk1uWEFQeTNmZmF0eVh2MzN0WXVpZGxzbWlweWtiRWR4b0NrX3NRQXZEX0J3RQ..*_gcl_au*MTk2MDIwMzcyMS4xNzg3MTYzOTg5LjE1NDU2MTg1LjE3ODgzMTM3ODEuMTc4ODMxMzc4Ny4zOTIwMDAxODQuMTc4ODMxMzc4MS4xNzg4MzEzNzg3*_ga*NTU1NDc1MzkuMTc2MzAwODA1OQ..*_ga_15W4STQT4T*czE3ODg4NzY3NDUkbzIxNiRnMCR0MTc4ODg3ODI1NSRqNjAkbDAkaDA.; Height: 2.5mm; Manufacturer_Part_Number: MSASE32MAB5107MPNA01; Mouser Part Number: 963-MSASE32MAB5107MP; Mouser Price/Stock: https://www.mouser.co.uk/ProductDetail/Wurth-Elektronik/865080343009?qs=0KOYDY2FL28Gid9q%2FqirTQ%3D%3D
C16 = MCAST21GBB5106KTNA01: as C7 on sheet MotorDriverChannel; Datasheet Link: https://www.mouser.com/catalog/specsheets/Taiyo%20Yuden_1102023_MC_mlcc_all_e.pdf; Manufacturer_Part_Number: MCAST21GBB5106KTNA01
C17 C21 = CAP_0603_X5R_25V: Capacitor 0603 generic, X5R, 25V
C18 C19 = GXT21BR61C226ME13L: as C10 on sheet MotorDriverChannel; Datasheet Link: https://www.mouser.de/datasheet/3/76/4/GXT21BR61C226ME13_01A.pdf; Manufacturer_Part_Number: GXT21BR61C226ME13L
C20 = CAP_0402_X5R_25V: Capacitor 0402 generic, X5R, 25V
D? = BAT43W_R1_00001: Schottky Diodes & Rectifiers 30V,Schottky,SOD-123,0.2A; Supplier Part Number 1: 3757-BAT43W_R1_00001CT-ND; Supplier 1: Digikey
H1 = BatteryWireSoldering: Manual soldering pads (TH), for BT2.0 pigtails using 22awg silicone wiring
IC2 = TPS61023DRLT: Switching Voltage Regulators 3.7-A boost converte r with 0.5-V ultra- A 595-TPS61023DRLR; Manufacturer_Name: Texas Instruments; Datasheet Link: http://www.ti.com/general/docs/suppproductinfo.tsp?distId=10&gotoUrl=http%3A%2F%2Fwww.ti.com%2Flit%2Fgpn%2Ftps61023; Height: 0.6mm; Manufacturer_Part_Number: TPS61023DRLT; Mouser Part Number: 595-TPS61023DRLT; Mouser Price/Stock: https://www.mouser.co.uk/ProductDetail/Texas-Instruments/TPS61023DRLT?qs=BJlw7L4Cy78Zr3IJIU3gNw%3D%3D; Arrow Part Number: TPS61023DRLT; Arrow Price/Stock: https://www.arrow.com/en/products/tps61023drlt/texas-instruments.html?utm_currency=USD&region=nac
L1 = 74438357010: Power Inductors - SMD WE-MAPI 1uH 7.4A DCR=13.5mOhms AEC-Q200; Manufacturer_Name: Wurth Elektronik; Datasheet Link: https://www.we-online.com/catalog/datasheet/74438357010.pdf; Height: 3.1mm; Manufacturer_Part_Number: 74438357010; Mouser Part Number: 710-74438357010; Mouser Price/Stock: https://www.mouser.co.uk/ProductDetail/Wurth-Elektronik/74438357010?qs=AQlKX63v8RstGPuQmrueWg%3D%3D; Arrow Part Number: 74438357010; Arrow Price/Stock: null?utm_currency=USD&region=asia
R21 = RES_0603: Resistor 0603 generic
R22 = AC0402FR-07768KL: Thick Film Resistors - SMD 768 kOhms 1/16 W 50 V 1 % 0402 100 PPM / C - 55 C / + 155 C AEC-Q200; Manufacturer_Name: YAGEO; Datasheet Link: https://www.mouser.de/datasheet/3/508/1/PYu-AC_51_RoHS_L_11.pdf; Manufacturer_Part_Number: AC0402FR-07768KL
R23 = AE0402BR-07100KL: as R5 on sheet MotorDriverChannel; Datasheet Link: https://yageogroup.com/content/datasheet/asset/file/PYU-AE_51_ROHS_L; Manufacturer_Part_Number: AE0402BR-07100KL
U2 = MIC5323-3.3YD5-TR: LDO Voltage Regulators 300mA uCap ULDO High PSRR Low Noise Regulator; Manufacturer_Name: Microchip Technology; Manufacturer_Part_Number: MIC5323-3.3YD5-TR; Datasheet Link: https://www.mouser.de/datasheet/3/282/1/MIC5323.pdf

## Sheet Interfacing.SchDoc
size A4; SheetNumber: 4; SheetTotal: 5
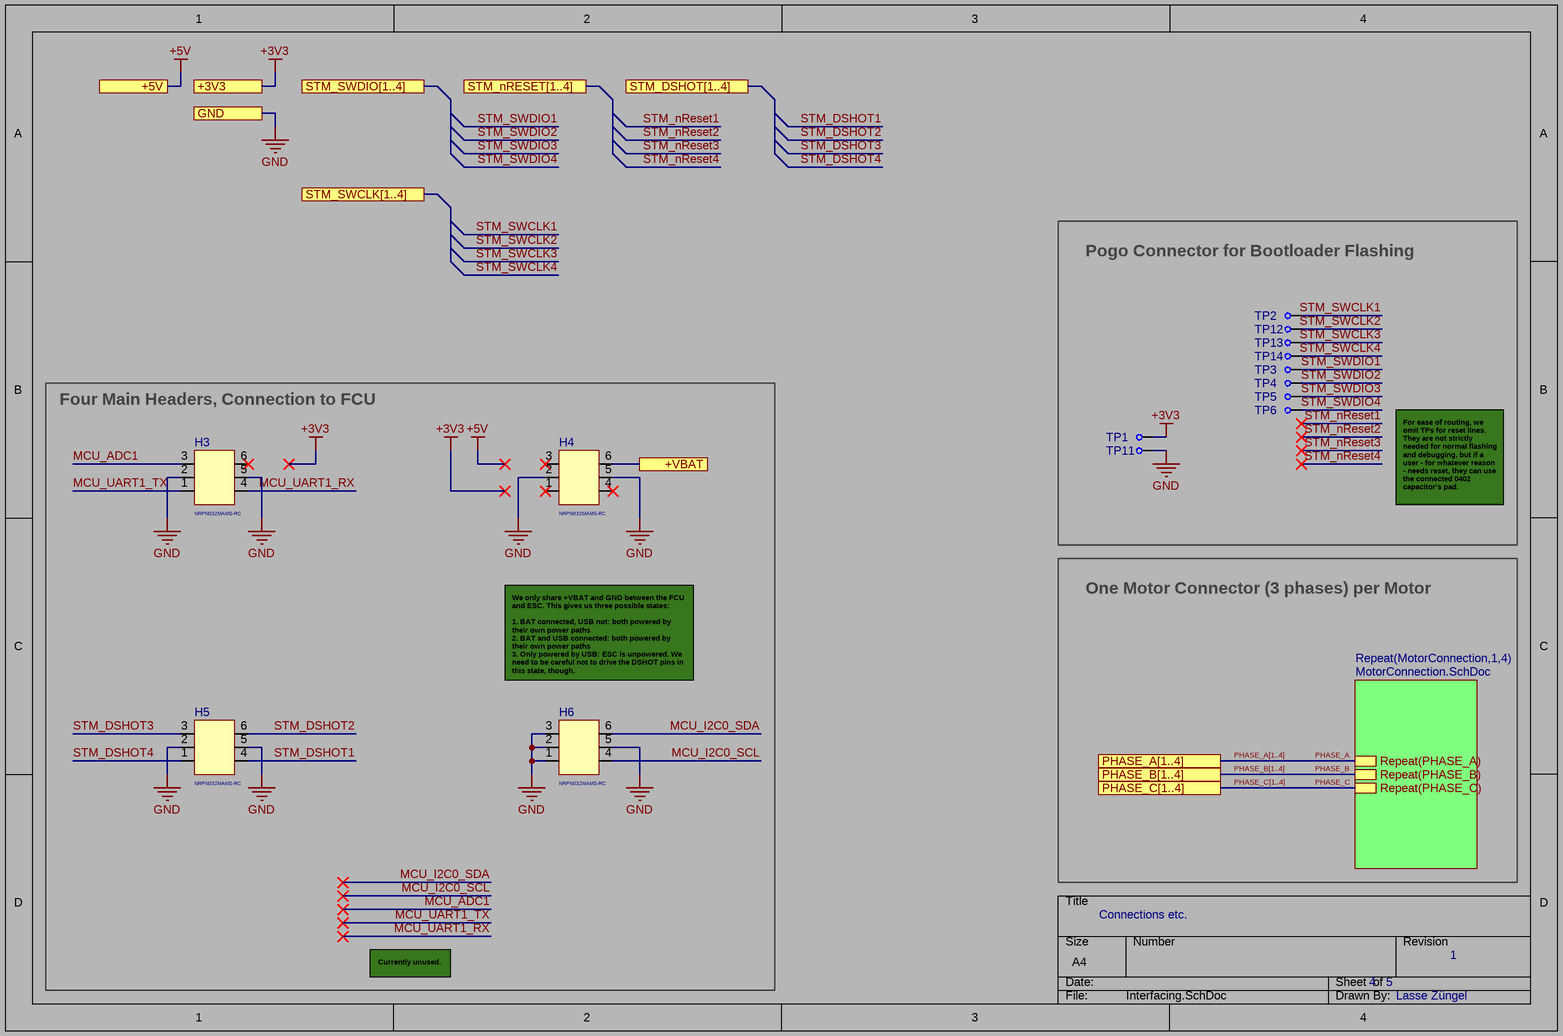
[diagram p3: Interfacing.SchDoc]

### Parts
H3  NRPN032MAMS-RC  [NRPN032MAMS-RC]
H4  NRPN032MAMS-RC  [NRPN032MAMS-RC]
H5  NRPN032MAMS-RC  [NRPN032MAMS-RC]
H6  NRPN032MAMS-RC  [NRPN032MAMS-RC]
TP1  TestPoint  [TestPoint]  (value not drawn)
TP2  TestPoint  [TestPoint]  (value not drawn)
TP3  TestPoint  [TestPoint]  (value not drawn)
TP4  TestPoint  [TestPoint]  (value not drawn)
TP5  TestPoint  [TestPoint]  (value not drawn)
TP6  TestPoint  [TestPoint]  (value not drawn)
TP11  TestPoint  [TestPoint]  (value not drawn)
TP12  TestPoint  [TestPoint]  (value not drawn)
TP13  TestPoint  [TestPoint]  (value not drawn)
TP14  TestPoint  [TestPoint]  (value not drawn)

### Blocks framed on the sheet
Pogo Connector for Bootloader Flashing: TP1-TP6 TP11-TP14
Four Main Headers, Connection to FCU: H3-H6

### Sub-sheets
Repeat(MotorConnection,1,4) = MotorConnection.SchDoc: Repeat(PHASE_A), Repeat(PHASE_B), Repeat(PHASE_C)

### Ports
+3V3 (see Main[3B], MotorDriverChannel[2C], Power[1B]), +5V (see Main[3C], MotorDriverChannel[2C], Power[1B]), +VBAT (see Main[3C], MotorDriverChannel[2C], Power[1B]), GND (see Main[3C], MotorDriverChannel[2C], Power[1B]), PHASE_A[1..4] (see Main[3C]), PHASE_B[1..4] (see Main[3C]), PHASE_C[1..4] (see Main[3C]), STM_DSHOT[1..4] (see Main[3C]), STM_nRESET[1..4] (see Main[3C]), STM_SWCLK[1..4] (see Main[3C]), STM_SWDIO[1..4] (see Main[3C])

### Nets
+3V3: TP1.1 ; port +3V3
+VBAT: H4.6 ; port +VBAT
GND: H3.2 H3.5 H4.2 H4.5 H5.2 H5.5 H6.1 H6.2 H6.3 H6.5 TP11.1 ; port GND
MCU_ADC1: H3.3
MCU_I2C0_SCL: H6.4
MCU_I2C0_SDA: H6.6
MCU_UART1_RX: H3.4
MCU_UART1_TX: H3.1
PHASE_A: sheet Repeat(MotorConnection,1,4)/Repeat(PHASE_A)
PHASE_B: sheet Repeat(MotorConnection,1,4)/Repeat(PHASE_B)
PHASE_C: sheet Repeat(MotorConnection,1,4)/Repeat(PHASE_C)
STM_DSHOT1: H5.4
STM_DSHOT2: H5.6
STM_DSHOT3: H5.3
STM_DSHOT4: H5.1
STM_SWCLK1: TP2.1
STM_SWCLK2: TP12.1
STM_SWCLK3: TP13.1
STM_SWCLK4: TP14.1
STM_SWDIO1: TP3.1
STM_SWDIO2: TP4.1
STM_SWDIO3: TP5.1
STM_SWDIO4: TP6.1

Not connected (* = marked no-connect by the designer): H3 6*; H4 1* 3* 4*

### Buses and harness runs
bus PHASE_A[1..4] = port PHASE_A[1..4]
bus PHASE_B[1..4] = port PHASE_B[1..4]
bus PHASE_C[1..4] = port PHASE_C[1..4]

### Notes on the sheet
- For ease of routing, we omit TPs for reset lines. They are not strictly needed for normal flashing and debugging, but if a user - for whatever reason - needs reset, they can use the connected 0402 capacitor's pad.
- One Motor Connector (3 phases) per Motor
- We only share +VBAT and GND between the FCU and ESC. This gives us three possible states:
  1. BAT connected, USB not: both powered by their own power paths
  2. BAT and USB connected: both powered by their own power paths
  3. Only powered by USB: ESC is unpowered. We need to be careful not to drive the DSHOT pins in this state, though.
- Connections etc.
- Currently unused.
- 4   5
- 1
- Lasse Züngel

### Library data of the parts
H3-H6 = NRPN032MAMS-RC: CONN HEADER SMD 6POS 2MM
TP1-TP6 TP11-TP14 = TestPoint: High density testpoint, diameter 0.7mm (very small)

## Sheet MotorConnection.SchDoc
size A4; SheetNumber: 5; SheetTotal: 5
Used 4 times, as channels U_Interfacing/MotorConnection1, U_Interfacing/MotorConnection2, U_Interfacing/MotorConnection3, U_Interfacing/MotorConnection4. Parts and nets are listed once, with the designators drawn on the sheet.
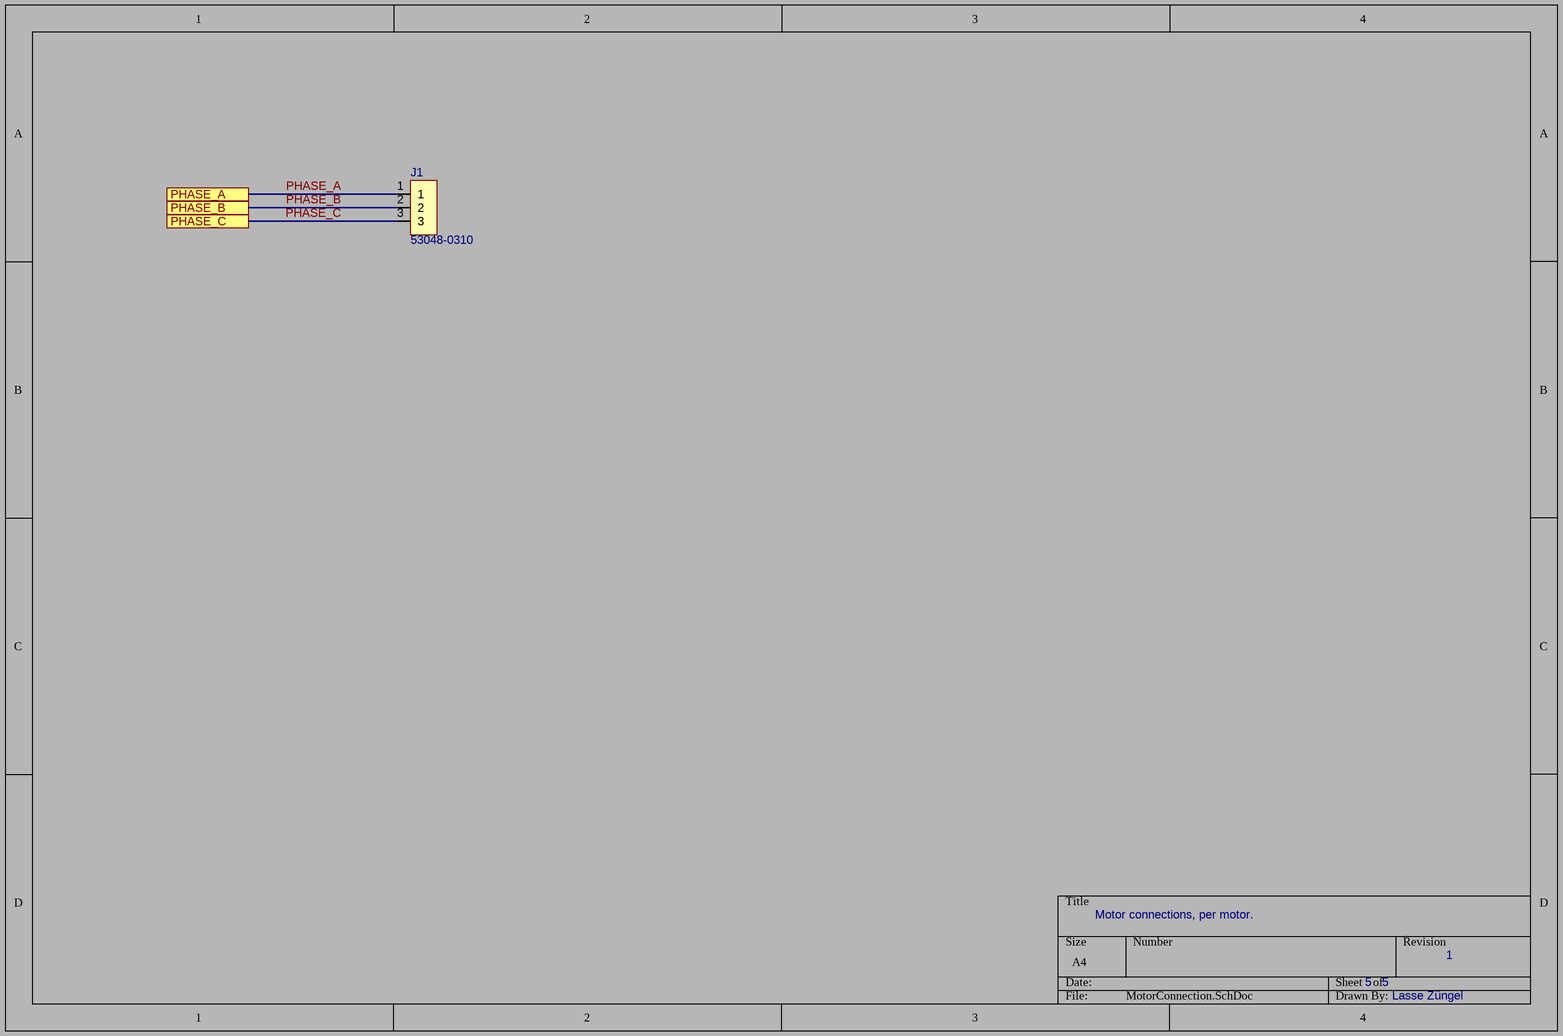
[diagram p4: MotorConnection.SchDoc]

### Parts
J1  53048-0310  [SHDRRA3W35P0X125_1X3_550X550X350P]

### Ports
PHASE_A (see Interfacing[4C], MotorDriverChannel[2C]), PHASE_B (see Interfacing[4D], MotorDriverChannel[2C]), PHASE_C (see Interfacing[4D], MotorDriverChannel[2C])

### Nets
PHASE_A: J1.1 ; port PHASE_A
PHASE_B: J1.2 ; port PHASE_B
PHASE_C: J1.3 ; port PHASE_C

### Channels
U_Interfacing/MotorConnection1: designators end in _MotorConnection1; ports PHASE_A=PHASE_A1 PHASE_B=PHASE_B1 PHASE_C=PHASE_C1
U_Interfacing/MotorConnection2: designators end in _MotorConnection2; ports PHASE_A=PHASE_A2 PHASE_B=PHASE_B2 PHASE_C=PHASE_C2
U_Interfacing/MotorConnection3: designators end in _MotorConnection3; ports PHASE_A=PHASE_A3 PHASE_B=PHASE_B3 PHASE_C=PHASE_C3
U_Interfacing/MotorConnection4: designators end in _MotorConnection4; ports PHASE_A=PHASE_A4 PHASE_B=PHASE_B4 PHASE_C=PHASE_C4

### Notes on the sheet
- Motor connections, per motor.
- 5   5
- 1
- Lasse Züngel

### Library data of the parts
J1 = 53048-0310: Connector JST 1.25mm pitch THT; Manufacturer_Name: Molex; Datasheet Link: https://www.molex.com/pdm_docs/sd/530481010_sd.pdf; Height: 3.5mm; Manufacturer_Part_Number: 53048-0310; Mouser Part Number: 538-53048-0310; Mouser Price/Stock: https://www.mouser.co.uk/ProductDetail/Molex/53048-0310?qs=zXrbR4Jv0OfUlEeVnlaifA%3D%3D

## Nets that join several sheets
+3V3: MOTOR1 (C1_MOTOR1.2 C2_MOTOR1.2 IC1_MOTOR1.3 R20_MOTOR1.2), MOTOR2 (C1_MOTOR2.2 C2_MOTOR2.2 IC1_MOTOR2.3 R20_MOTOR2.2), MOTOR3 (C1_MOTOR3.2 C2_MOTOR3.2 IC1_MOTOR3.3 R20_MOTOR3.2), MOTOR4 (C1_MOTOR4.2 C2_MOTOR4.2 IC1_MOTOR4.3 R20_MOTOR4.2), Power (C21.2 U2.5), Interfacing (TP1.1)
+5V: MOTOR1 (C3_MOTOR1.2 C4_MOTOR1.2 U1_MOTOR1.1), MOTOR2 (C3_MOTOR2.2 C4_MOTOR2.2 U1_MOTOR2.1), MOTOR3 (C3_MOTOR3.2 C4_MOTOR3.2 U1_MOTOR3.1), MOTOR4 (C3_MOTOR4.2 C4_MOTOR4.2 U1_MOTOR4.1), Power (7 pins)
+VBAT: MOTOR1 (19 pins), MOTOR2 (19 pins), MOTOR3 (19 pins), MOTOR4 (19 pins), Power (6 pins), Interfacing (H4.6)
GND: MOTOR1 (24 pins), MOTOR2 (24 pins), MOTOR3 (24 pins), MOTOR4 (24 pins), Power (11 pins), Interfacing (11 pins)
PHASE_A1: MOTOR1 (10 pins), U_Interfacing/MotorConnection1 (J1_MotorConnection1.1)
PHASE_A2: MOTOR2 (10 pins), U_Interfacing/MotorConnection2 (J1_MotorConnection2.1)
PHASE_A3: MOTOR3 (10 pins), U_Interfacing/MotorConnection3 (J1_MotorConnection3.1)
PHASE_A4: MOTOR4 (10 pins), U_Interfacing/MotorConnection4 (J1_MotorConnection4.1)
PHASE_B1: MOTOR1 (10 pins), U_Interfacing/MotorConnection1 (J1_MotorConnection1.2)
PHASE_B2: MOTOR2 (10 pins), U_Interfacing/MotorConnection2 (J1_MotorConnection2.2)
PHASE_B3: MOTOR3 (10 pins), U_Interfacing/MotorConnection3 (J1_MotorConnection3.2)
PHASE_B4: MOTOR4 (10 pins), U_Interfacing/MotorConnection4 (J1_MotorConnection4.2)
PHASE_C1: MOTOR1 (10 pins), U_Interfacing/MotorConnection1 (J1_MotorConnection1.3)
PHASE_C2: MOTOR2 (10 pins), U_Interfacing/MotorConnection2 (J1_MotorConnection2.3)
PHASE_C3: MOTOR3 (10 pins), U_Interfacing/MotorConnection3 (J1_MotorConnection3.3)
PHASE_C4: MOTOR4 (10 pins), U_Interfacing/MotorConnection4 (J1_MotorConnection4.3)